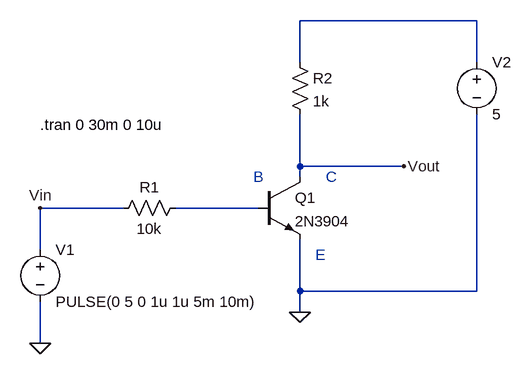
[diagram p0: schematic W02_D07_NPN_BJT_Switch.asc]
W02_D07_NPN_BJT_Switch.asc, the LTspice schematic file:
Version 4.1
SHEET 1 880 680
WIRE 704 -208 432 -208
WIRE 432 -144 432 -208
WIRE 704 -144 704 -208
WIRE 432 16 432 -64
WIRE 592 16 432 16
WIRE 432 32 432 16
WIRE 160 80 32 80
WIRE 368 80 240 80
WIRE 32 144 32 80
WIRE 432 208 432 128
WIRE 704 208 704 -64
WIRE 704 208 432 208
WIRE 432 240 432 208
WIRE 32 288 32 224
FLAG 32 288 0
FLAG 432 240 0
FLAG 32 80 Vin
FLAG 592 16 Vout
SYMBOL voltage 32 128 R0
WINDOW 123 0 0 Left 0
WINDOW 39 0 0 Left 0
SYMATTR InstName V1
SYMATTR Value PULSE(0 5 0 1u 1u 5m 10m)
SYMBOL res 256 64 R90
WINDOW 0 0 56 VBottom 2
WINDOW 3 32 56 VTop 2
SYMATTR InstName R1
SYMATTR Value 10k
SYMBOL res 416 -160 R0
SYMATTR InstName R2
SYMATTR Value 1k
SYMBOL npn 368 32 R0
SYMATTR InstName Q1
SYMATTR Value 2N3904
SYMBOL voltage 704 -160 R0
SYMATTR InstName V2
SYMATTR Value 5
TEXT 360 32 Left 2 ;B
TEXT 472 32 Left 2 ;C
TEXT 456 152 Left 2 ;E
TEXT 32 -48 Left 2 !.tran 0 30m 0 10u

The netlist it stands for:
* W02_D07_NPN_BJT_Switch.asc
V1 Vin 0 PULSE(0 5 0 1u 1u 5m 10m)
R1 N002 Vin 10k
R2 N001 Vout 1k
Q1 Vout N002 0 0 2N3904
V2 N001 0 5
.model NPN NPN
.model PNP PNP
.lib standard.bjt
* B
* C
* E
.tran 0 30m 0 10u
.backanno
.end